# Altium schematic sheet overview.SchDoc
size A4; SheetNumber: 1; SheetTotal: 5
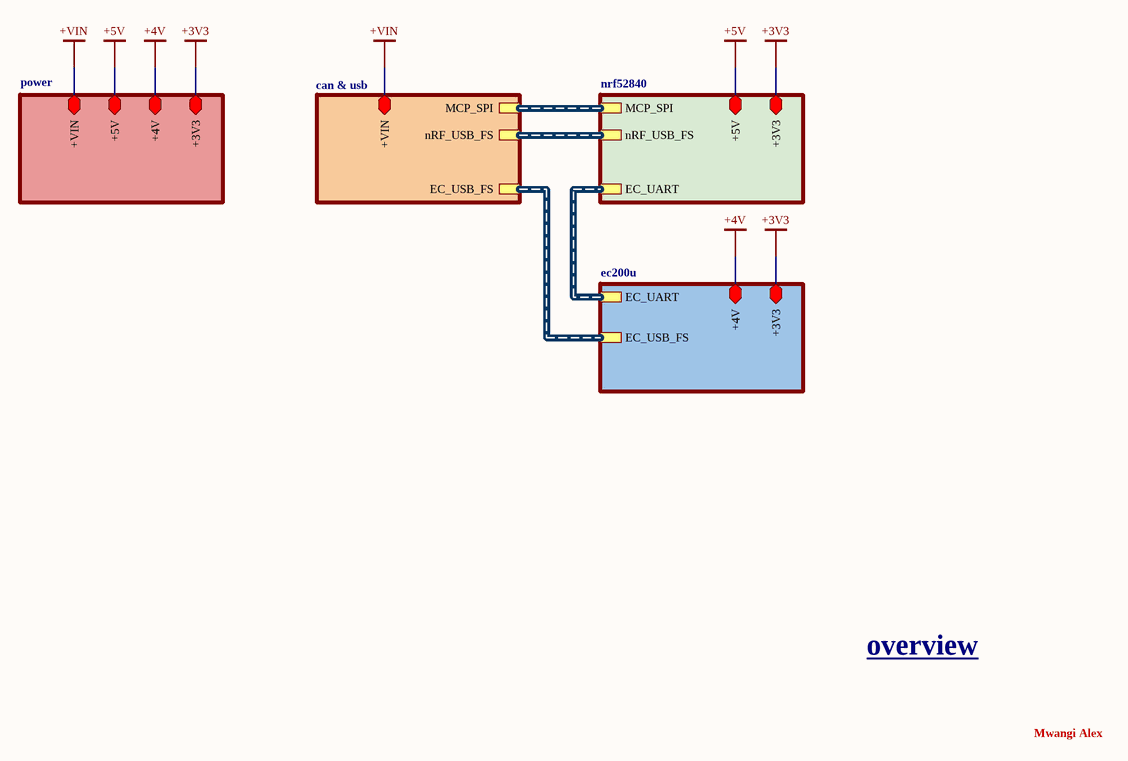
[diagram p0: overview.SchDoc]

## Sub-sheets
can & usb = can&usb.SchDoc: MCP_SPI (harness CAN_UART), +VIN (bidir), nRF_USB_FS (harness nRF_USB_FS), EC_USB_FS (harness EC_USB_FS)
ec200u = ec200u.SchDoc: EC_UART (harness EC_UART), +3V3 (bidir), +4V (bidir), EC_USB_FS (harness EC_USB_FS)
nrf52840 = nrf52840.SchDoc: EC_UART (harness EC_UART), MCP_SPI (harness CAN_UART), +3V3 (bidir), nRF_USB_FS (harness nRF_USB_FS), +5V (bidir)
power = pwr.SchDoc: +3V3 (bidir), +5V (bidir), +4V (bidir), +VIN (bidir)

## Nets
+3V3: sheet power/+3V3, sheet nrf52840/+3V3, sheet ec200u/+3V3
+4V: sheet power/+4V, sheet ec200u/+4V
+5V: sheet power/+5V, sheet nrf52840/+5V
+VIN: sheet power/+VIN, sheet can & usb/+VIN

## Buses and harness runs
harness sheet can & usb/EC_USB_FS = sheet ec200u/EC_USB_FS
harness sheet can & usb/MCP_SPI = sheet nrf52840/MCP_SPI
harness sheet can & usb/nRF_USB_FS = sheet nrf52840/nRF_USB_FS
harness sheet ec200u/EC_UART = sheet nrf52840/EC_UART

## Notes on the sheet
- overview
- Mwangi Alex